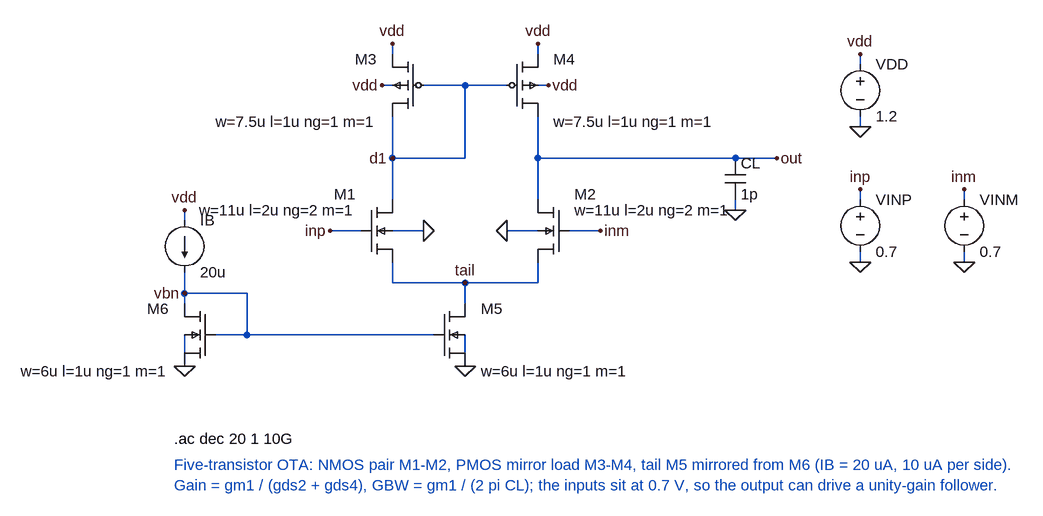
[diagram p0: schematic ota5t.asc]
ota5t.asc, the LTspice schematic file:
Version 4
SHEET 1 1200 900
WIRE 240 96 240 80
WIRE 240 144 224 144
WIRE 464 96 464 80
WIRE 464 144 480 144
WIRE 288 144 416 144
WIRE 192 368 144 368
WIRE 240 368 288 368
WIRE 512 368 560 368
WIRE 464 368 416 368
WIRE 240 192 240 320
WIRE 240 256 352 256
WIRE 352 256 352 144
WIRE 464 192 464 320
WIRE 464 256 832 256
WIRE 768 320 768 336
WIRE 240 416 240 448
WIRE 240 448 464 448
WIRE 464 448 464 416
WIRE 352 480 352 448
WIRE -32 528 304 528
WIRE -80 352 -80 336
WIRE -80 432 -80 480
WIRE -80 464 16 464
WIRE 16 464 16 528
WIRE 352 528 352 576
WIRE -80 528 -80 576
WIRE 960 112 960 96
WIRE 960 192 960 208
WIRE 960 320 960 304
WIRE 960 400 960 416
WIRE 1120 320 1120 304
WIRE 1120 400 1120 416
FLAG 240 80 vdd
FLAG 224 144 vdd
FLAG 464 80 vdd
FLAG 480 144 vdd
FLAG 144 368 inp
FLAG 288 368 0
FLAG 560 368 inm
FLAG 416 368 0
FLAG 240 256 d1
FLAG 832 256 out
FLAG 768 336 0
FLAG 352 448 tail
FLAG -80 336 vdd
FLAG -80 464 vbn
FLAG 352 576 0
FLAG -80 576 0
FLAG 960 96 vdd
FLAG 960 208 0
FLAG 960 304 inp
FLAG 960 416 0
FLAG 1120 304 inm
FLAG 1120 416 0
SYMBOL sg13g2\sg13_lv_pmos 288 96 M0
WINDOW 0 72 8 Left 2
WINDOW 3 0 0 Invisible 2
WINDOW 39 72 104 Left 2
SYMATTR InstName M3
SYMATTR SpiceLine w=7.5u l=1u ng=1 m=1
SYMBOL sg13g2\sg13_lv_pmos 416 96 R0
WINDOW 0 72 8 Left 2
WINDOW 3 0 0 Invisible 2
WINDOW 39 72 104 Left 2
SYMATTR InstName M4
SYMATTR SpiceLine w=7.5u l=1u ng=1 m=1
SYMBOL sg13g2\sg13_lv_nmos 192 320 R0
WINDOW 0 -8 -8 Right 2
WINDOW 3 0 0 Invisible 2
WINDOW 39 -8 16 Right 2
SYMATTR InstName M1
SYMATTR SpiceLine w=11u l=2u ng=2 m=1
SYMBOL sg13g2\sg13_lv_nmos 512 320 M0
WINDOW 0 -8 -8 Right 2
WINDOW 3 0 0 Invisible 2
WINDOW 39 -8 16 Right 2
SYMATTR InstName M2
SYMATTR SpiceLine w=11u l=2u ng=2 m=1
SYMBOL cap 752 256 R0
SYMATTR InstName CL
SYMATTR Value 1p
SYMBOL sg13g2\sg13_lv_nmos 304 480 R0
WINDOW 0 72 8 Left 2
WINDOW 3 0 0 Invisible 2
WINDOW 39 72 104 Left 2
SYMATTR InstName M5
SYMATTR SpiceLine w=6u l=1u ng=1 m=1
SYMBOL sg13g2\sg13_lv_nmos -32 480 M0
WINDOW 0 72 8 Left 2
WINDOW 3 0 0 Invisible 2
WINDOW 39 72 104 Left 2
SYMATTR InstName M6
SYMATTR SpiceLine w=6u l=1u ng=1 m=1
SYMBOL current -80 352 R0
SYMATTR InstName IB
SYMATTR Value 20u
SYMBOL voltage 960 96 R0
SYMATTR InstName VDD
SYMATTR Value 1.2
SYMBOL voltage 960 304 R0
SYMATTR InstName VINP
SYMATTR Value 0.7
SYMATTR Value2 AC 1
SYMBOL voltage 1120 304 R0
SYMATTR InstName VINM
SYMATTR Value 0.7
TEXT -96 688 Left 2 !.ac dec 20 1 10G
TEXT -96 728 Left 2 ;Five-transistor OTA: NMOS pair M1-M2, PMOS mirror load M3-M4, tail M5 mirrored from M6 (IB = 20 uA, 10 uA per side).\nGain = gm1 / (gds2 + gds4), GBW = gm1 / (2 pi CL); the inputs sit at 0.7 V, so the output can drive a unity-gain follower.

The netlist it stands for:
* ota5t.asc
XM3 d1 d1 vdd vdd sg13_lv_pmos w=7.5u l=1u ng=1 m=1  ; pins D G S B
XM4 out d1 vdd vdd sg13_lv_pmos w=7.5u l=1u ng=1 m=1  ; pins D G S B
XM1 d1 inp tail 0 sg13_lv_nmos w=11u l=2u ng=2 m=1  ; pins D G S B
XM2 out inm tail 0 sg13_lv_nmos w=11u l=2u ng=2 m=1  ; pins D G S B
CL out 0 1p
XM5 tail vbn 0 0 sg13_lv_nmos w=6u l=1u ng=1 m=1  ; pins D G S B
XM6 vbn vbn 0 0 sg13_lv_nmos w=6u l=1u ng=1 m=1  ; pins D G S B
IB vdd vbn 20u
VDD vdd 0 1.2
VINP inp 0 0.7 AC 1
VINM inm 0 0.7
.ac dec 20 1 10G
* Five-transistor OTA: NMOS pair M1-M2, PMOS mirror load M3-M4, tail M5 mirrored from M6 (IB = 20 uA, 10 uA per side).
* Gain = gm1 / (gds2 + gds4), GBW = gm1 / (2 pi CL); the inputs sit at 0.7 V, so the output can drive a unity-gain follower.
.backanno
.end